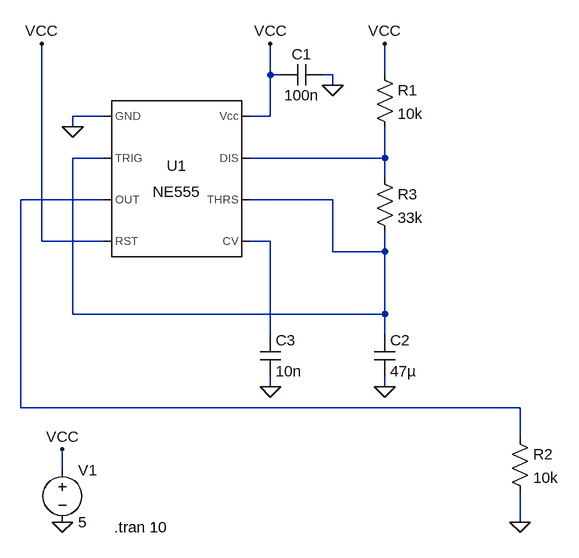
[diagram p0: schematic 555_Square.asc]
555_Square.asc, the LTspice schematic file:
Version 4.1
SHEET 1 880 680
WIRE -304 -160 -304 -208
WIRE -288 -160 -304 -160
WIRE -208 -160 -224 -160
WIRE -128 -160 -128 -208
WIRE -208 -144 -208 -160
WIRE -560 -96 -608 -96
WIRE -304 -96 -304 -160
WIRE -304 -96 -336 -96
WIRE -608 -80 -608 -96
WIRE -560 -32 -608 -32
WIRE -128 -32 -128 -80
WIRE -128 -32 -336 -32
WIRE -128 0 -128 -32
WIRE -560 32 -688 32
WIRE -208 32 -336 32
WIRE -656 96 -656 -208
WIRE -560 96 -656 96
WIRE -304 96 -336 96
WIRE -208 112 -208 32
WIRE -128 112 -128 80
WIRE -128 112 -208 112
WIRE -608 208 -608 -32
WIRE -128 208 -128 112
WIRE -128 208 -608 208
WIRE -304 240 -304 96
WIRE -128 240 -128 208
WIRE -304 320 -304 304
WIRE -128 320 -128 304
WIRE -688 352 -688 32
WIRE 80 352 -688 352
WIRE 80 400 80 352
WIRE -624 448 -624 416
WIRE 80 528 80 480
FLAG -608 -80 0
FLAG -208 -144 0
FLAG -304 -208 VCC
FLAG -128 -208 VCC
FLAG -656 -208 VCC
FLAG -128 320 0
FLAG -304 320 0
FLAG -624 528 0
FLAG -624 416 VCC
FLAG 80 528 0
SYMBOL Misc\\NE555 -448 0 R0
SYMATTR InstName U1
SYMBOL cap -224 -176 R90
WINDOW 0 0 32 VBottom 2
WINDOW 3 32 32 VTop 2
SYMATTR InstName C1
SYMATTR Value 100n
SYMBOL res -144 -176 R0
SYMATTR InstName R1
SYMATTR Value 10k
SYMBOL res -144 -16 R0
SYMATTR InstName R3
SYMATTR Value 33k
SYMBOL cap -144 240 R0
SYMATTR InstName C2
SYMATTR Value 47µ
SYMBOL cap -320 240 R0
SYMATTR InstName C3
SYMATTR Value 10n
SYMBOL voltage -624 432 R0
WINDOW 123 0 0 Left 0
WINDOW 39 0 0 Left 0
SYMATTR InstName V1
SYMATTR Value 5
SYMBOL res 64 384 R0
SYMATTR InstName R2
SYMATTR Value 10k
TEXT -544 536 Left 2 !.tran 10

The netlist it stands for:
* 555_Square.asc
X§U1 0 N001 N003 VCC N004 N001 N002 VCC NE555  ; pins GND TRIG OUT RST CV THRS DIS Vcc
C1 0 VCC 100n
R1 VCC N002 10k
R3 N002 N001 33k
C2 N001 0 47µ
C3 N004 0 10n
V1 VCC 0 5
R2 N003 0 10k
.tran 10
.lib NE555.sub
.backanno
.end